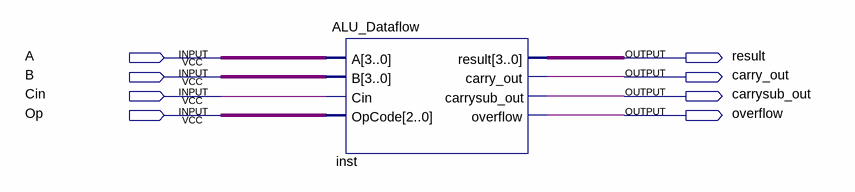
[diagram p0: schematic sheet]
// Quartus schematic Block_dataflow.bdf as structural Verilog: 1 symbols, 8 pins
module Block_dataflow (
  input  A,
  input  B,
  input  Cin,
  input  Op,
  output result,
  output carry_out,
  output carrysub_out,
  output overflow
);

  wire [2:0] undriven_3;
  wire [3:0] inst_result, undriven, undriven_2;

  ALU_Dataflow inst (
    .A(undriven), .B(undriven_2), .Cin(Cin), .OpCode(undriven_3), .result(inst_result),
    .carry_out(carry_out), .carrysub_out(carrysub_out), .overflow(overflow));
endmodule
